# Altium project Linear Charger Power PCB.PrjPcb
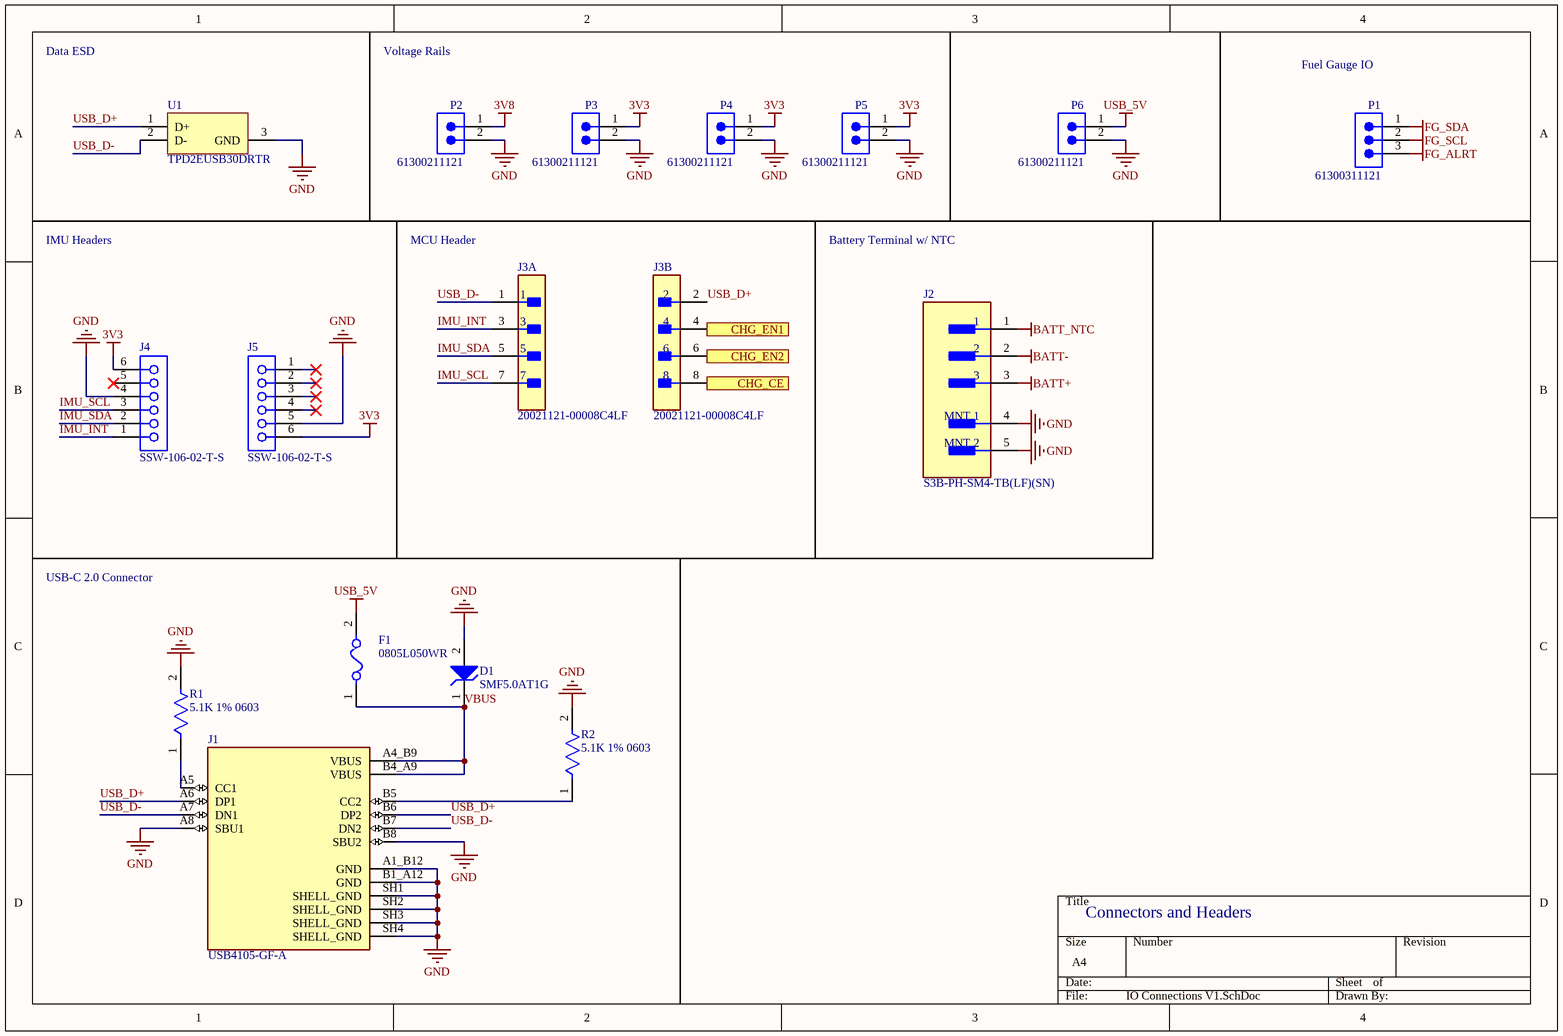
[diagram p0: IO Connections V1.SchDoc]
3 sheets, 47 parts. Net scope: flat (ports and power ports of the same name join across sheets).
Board file: Linear Charge PCB.PcbDoc
Sheets:
  IO Connections V1.SchDoc
  Charge Managment ICs.SchDoc
  Voltage Regs.SchDoc

## Sheet IO Connections V1.SchDoc
size A4; SheetNumber: 1; SheetTotal: 3

### Parts
D1  SMF5.0AT1G  [ONSC-SOD-123FL-2-498_V]
F1  0805L050WR  [FP-0805L-MFG]
J1  USB4105-GF-A  [GCT_USB4105-GF-A]
J2  S3B-PH-SM4-TB(LF)(SN)  [FP-S3B-PH-SM4-TB_LF_SN-MFG]
J3  20021121-00008C4LF  [FP-20021121-00008C4LF-MFG]  (parts A,B of 2)
J4  SSW-106-02-T-S  [SMTC-SSW-106-02-X-S]
J5  SSW-106-02-T-S  [SMTC-SSW-106-02-X-S]
P1  61300311121  [61300311121]
P2  61300211121  [61300211121]
P3  61300211121  [61300211121]
P4  61300211121  [61300211121]
P5  61300211121  [61300211121]
P6  61300211121  [61300211121]
R1  5.1K 1% 0603  [FP-AF0603-MFG]
R2  5.1K 1% 0603  [FP-AF0603-MFG]
U1  TPD2EUSB30DRTR  [DRT0003A]

### Ports
CHG_CE (out), CHG_EN1 (out), CHG_EN2 (out)

### Nets
3V3: J4.6 J5.6 P3.1 P4.1 P5.1
3V8: P2.1
BATT+: J2.3
BATT-: J2.2
BATT_NTC: J2.1
FG_ALRT: P1.3
FG_SCL: P1.2
FG_SDA: P1.1
GND: D1.2(A) J1.A1_B12(GND) J1.A8(SBU1) J1.B1_A12(GND) J1.B8(SBU2) J1.SH1(SHELL_GND) J1.SH2(SHELL_GND) J1.SH3(SHELL_GND) J1.SH4(SHELL_GND) J2.4(MNT_1) J2.5(MNT_2) J4.4 J5.5 P2.2 P3.2 P4.2 P5.2 P6.2 R1.2 R2.2 U1.3(GND)
USB_5V: F1.2 P6.1
IMU_INT: J3.3 J4.1
IMU_SCL: J3.7 J4.3
IMU_SDA: J3.5 J4.2
USB_D+: J1.A6(DP1) J1.B6(DP2) J3.2 U1.1(D+)
USB_D-: J1.A7(DN1) J1.B7(DN2) J3.1 U1.2(D-)
VBUS: D1.1(K) F1.1 J1.A4_B9(VBUS) J1.B4_A9(VBUS)
NetJ1_A5: J1.A5(CC1) R1.1
NetJ1_B5: J1.B5(CC2) R2.1
NetJ3_4: J3.4 ; port CHG_EN1
NetJ3_6: J3.6 ; port CHG_EN2
NetJ3_8: J3.8 ; port CHG_CE

Not connected (* = marked no-connect by the designer): J4 5*; J5 1* 2* 3* 4*

### Notes on the sheet
- Data ESD
- Voltage Rails
- Fuel Gauge IO
- IMU Headers
- MCU Header
- Battery Terminal w/ NTC
- USB-C 2.0 Connector
- Connectors and Headers

### Library data of the parts
D1 = CMP-1061-00612-1: 200 W Transient Voltage Suppressor, 2-Pin SOD-123FL, Pb-Free, Tape and Reel; Manufacturer: On Semiconductor; Direction: Unidirectional; IR Max (uA): 400; V(BR) Typ (V): 6.7; PackageDescription: 2-Pin SOD, Body 1.65 x 2.7 mm; PartNumber: SMF5.0AT1G; ComponentLink3Description: Package Specification; ComponentLink3URL: http://www.onsemi.com/pub_link/Collateral/498-01.PDF; PackageVersion: Rev. D, 05/2013; Mounting Technology: Surface Mount; PackageReference: SOD-123FL-2-498; ComponentLink2URL: http://www.onsemi.com/pub_link/Collateral/SMF5.0AT1-D.PDF; DatasheetVersion: Rev. 7; ComponentLink1Description: Manufacturer URL; Packing: Tape and Reel; RoHS: Pb-Free; ComponentLink1URL: http://www.onsemi.com/; ComponentLink2Description: Datasheet
F1 = CMP-08606-000023-1: PTC RESET FUSE 6V 500MA 0805; Manufacturer: Littelfuse Inc.; Current Rating: 100A; Hold Current: 0.5A; Value: 0.15-0.85Ω; Trip Time: 0.1s; Trip Current: 1A; Device Class L2: PTC Resettable Fuses; Manufacturer Part Number: 0805L050WR; Digikey Description: PTC RESET FUSE 6V 500MA 0805; ComponentLink2URL: https://www.littelfuse.com/~/media/electronics/datasheets/resettable_ptcs/littelfuse_ptc_0805l_datasheet.pdf.pdf; Package: 0805L; RoHS: TRUE; Temperature Range Low: -40°C; Octopart: https://octopart.com/0805l050wr-littelfuse-673858; Resistance: 0.15-0.85Ω; ComponentLink2Description: Datasheet; Category: Fuse; Height: 1.25mm; Mouser Description: PTC Resettable Fuse 0.5A(hold) 1A(trip) 6VDC 100A 0.5W 0.1s 0.15Ohm SMD Solder Pad 0805 T/R; Ambient Temperature Range High: +85°C; Automotive: No; Device Class L3: unset; Lead Free: Yes; Temperature: -40°C to +85°C; Voltage Rating: 6V; Ambient Temperature Range Low: -40°C; Temperature Range High: +85°C; Device Class L1: Circuit Protection
J1 = USB4105-GF-A: MF: {'manufacturer': u'GCT'}; Package: None; Price: None; Value: *; MP: USB4105-GF-A; Availability: Unavailable
J2 = CMP-2000-07023-2: CONN HEADER SMD R/A 3POS 2MM; Voltage Rating: 100V; Gender: Male; Max Current Rating: 2A; Number of Contacts: 3; Insulation Resistance: 1GR; Contact Resistance: 10mR; Termination: Solder; Orientation: Right Angle; Insulation Color: Natural; Flammability Rating: UL94 V-0; Width: 5mm; Lead Free: Lead Free; Mount: Surface Mount; Max Operating Temperature: 85°C; Connector Type: Header; Fastening Type: Detent; Max Voltage Rating (DC): 100V; Housing Material: Polyamide; Number of Rows: 1; Housing Color: Beige; Contact Plating: Tin; Contact Shape: Square; Working Voltage: 100V; Contact Material: Copper Alloy; Contact Mating Length: 0.13inch; Contact Type: Male Pin; Max Voltage Rating (AC): 100V; Packaging: Tape and Reel; Min Operating Temperature: -25°C; Number of Positions: 3; REACH SVHC: No SVHC; Contact Finish - Mating: TIN; Color: Natural; Length: 9.9mm; Insulation Material: Nylon; Depth: 7.6mm; Current Rating: 2A; Material: Polyamide; Voltage Rating (AC): 100V; Pitch: 2mm; Series: PH; Height: 9.4mm; Number of Poles: 3; Lead Pitch: 2mm
J3 = CMP-15126-126517167-1: 20021121-00008C4LF Conn Unshrouded Header HDR 8 POS 1.27mm Solder ST Top Entry SMD Minitek127® T/R; Mating Post Length: 3.05mm; Stack Height: 3mm; Max Voltage Rating (AC): 125V; Number of Contacts: 8; Connector Type: Header, Male Pin; Current Rating: 1A; Gender: Male; Contact Resistance: 30mΩ; Orientation: Straight; Depth: 3.4mm; Min Operating Temperature: -55°C; NexarPartId: 126517167; Contact Mating Length: 3.048mm; Contact Material: Copper; Number of Rows: 2; RoHS: Compliant; Height: 5.05mm; Number of Pins: 8; REACH SVHC: No SVHC; Length: 5.08mm; Housing Color: Black; Pitch: 1.27mm; Termination: Solder; Mount: Surface Mount; Color: Black; Contact Plating: Gold; Row Spacing: 1.27mm; Number of Positions: 8; Housing Material: Thermoplastic; Max Operating Temperature: 85°C; Voltage Rating: 125V
J4 J5 = CMP-1023-00360-1: SQ Post Socket, Through-hole, Vertical, -55 to 105 degC, 2.54mm Pitch, 6-Pin, Female, RoHS; Manufacturer: Samtec; ComponentLink1URL: http://www.samtec.com; Temperature Range: -55 to 105 degC; Pitch: 2.54 mm; Mounting Technology: Through-hole; DatasheetVersion: F-214; ComponentLink1Description: Manufacturer URL; PackageVersion: CA, 6/1987; ComponentLink3Description: Package Specification; PackageDescription: Assembly, Socket Strip .016 X .031 Tail; ComponentLink2Description: Datasheet; ComponentLink2URL: http://www.samtec.com/documents/webfiles/pdf/SSW_TH.PDF; PackageReference: SSW-106-02-X-S; ComponentLink3URL: http://www.samtec.com/documents/webfiles/cpdf/SSW-1XX-XX-XXX-X-XX-XXX-XX-MKT.pdf; RoHS: True; PartNumber: SSW-106-02-T-S; Orientation: Vertical
P1 = CMP-1502-01062-4: THT Vertical Pin Header WR-PHD, Pitch 2.54 mm, Single Row, 3 pins; Connector Type: Male Pin; Number of Contacts: 3; Operating Supply Voltage: 250V; Current Rating: 3A; Pitch: 2.54mm; Contact Resistance: 20mΩ; Gender: Male; Height: 8.94mm; Color: Black; Min Operating Temperature: -40°C; Max Operating Temperature: 105°C; Mount: Through Hole; Termination: Solder; Number of Rows: 1; Packaging: Bulk; Number of Pins: 3; Lead Pitch: 2.54mm; RoHS: Compliant; Contact Plating: Gold; Number of Positions: 3; Lead Free: Lead Free; Voltage Rating: 250V; Contact Mating Length: 5.9944mm; Orientation: Vertical; Contact Material: Gold
P2-P6 = CMP-1712-00002-7: THT Vertical Pin Header WR-PHD, Pitch 2.54 mm, Single Row, 2 pins; Pitch: 2.54mm; Number of Contacts: 2; Connector Type: Male Pin; Gender: Male; Contact Resistance: 20mΩ; Operating Supply Voltage: 250V; Current Rating: 3A; Housing Material: PBT; RoHS: Compliant; Lead Free: Lead Free; Contact Material: Gold; REACH SVHC: No; Min Operating Temperature: -40°C; Termination: Through Hole; Number of Pins: 2; Contact Gender: Male; Packaging: Bulk; Lead Pitch: 2.54mm; Contact Plating: Gold; Orientation: Vertical; Mount: Through Hole; Height: 8.94mm; Color: Black; Number of Positions: 2; Contact Mating Length: 5.9944mm; Max Operating Temperature: 105°C; Voltage Rating: 250V; Number of Rows: 1
R1 R2 = CMP-03412-041991-1: Anti-Sulfurated Chip Resistors Automotive Grade 5.1kΩ 1% 100ppm/°C 0603; Max Power Dissipation: 100mW; Resistance: 5.1kR; Case/Package: 0603; Features: Moisture Resistant; Tolerance: 1%; Packaging: Tape and Reel; Number of Terminations: 2; Max Operating Temperature: 155°C; Height: 0.022inch; Temperature Coefficient: 100ppm/°C; Resistor Type: Thick Film; Width: 0.031inch; Min Operating Temperature: -55°C; Length: 0.063inch; RoHS Compliant: Yes; Series: AF
U1 = CMP-0326-00046-3: ESD Solution for Super-Speed (6 Gbps) USB 3.0 Interface, 2 Channels, -40 to +85 degC, 3-pin SOT (DRT), Green (Rohs & No Sb/Br); Manufacturer: Texas Instruments; Differential Capacitance(pF): 0.01; Breakdown Voltage(Min)(V): 9; HDMI: TRUE; IEC 61000-4-2 Air-Gap(+/- kV): 8; IO Leakage Current(nA): 10; IO Capacitance(Typ)(pF): 0.7; Mounting Technology: Surface Mount; PackageDescription: 3-Flat Lead Plastic Small Outline, 1 x 1 mm (inc leads), 0.35 mm Pitch; IEC 61000-4-2 Contact(+/- kV): 8; USB Super Speed: TRUE; Eco-Plan: Green (RoHS & no Sb/Br); USB High Speed: TRUE; PackageReference: DRT0003A; SubFamily: ESD Solution; USB Full Speed: TRUE; ComponentLink1Description: Datasheet; ComponentLink2URL: SamplesURL:http://www.ti.com/product/tpd2eusb30#samples; PackageVersion: revD, Jun-2008; ComponentLink2Description: URL Link1; 1394 / Firewire: TRUE; PartNumber: TPD2EUSB30DRTR; ComponentLink1URL: http://www.ti.com/general/docs/lit/getliterature.tsp?genericPartNumber=TPD2EUSB30&fileType=pdf; DatasheetVersion: SLVSAC2C; Serial ATA / eSATA: TRUE

## Sheet Charge Managment ICs.SchDoc
size A4; SheetNumber: 2; SheetTotal: 3; SPICEModelCacheYUDMBZLM: <root> / <DocumentId>YUDMBZLM</DocumentId> / </root>
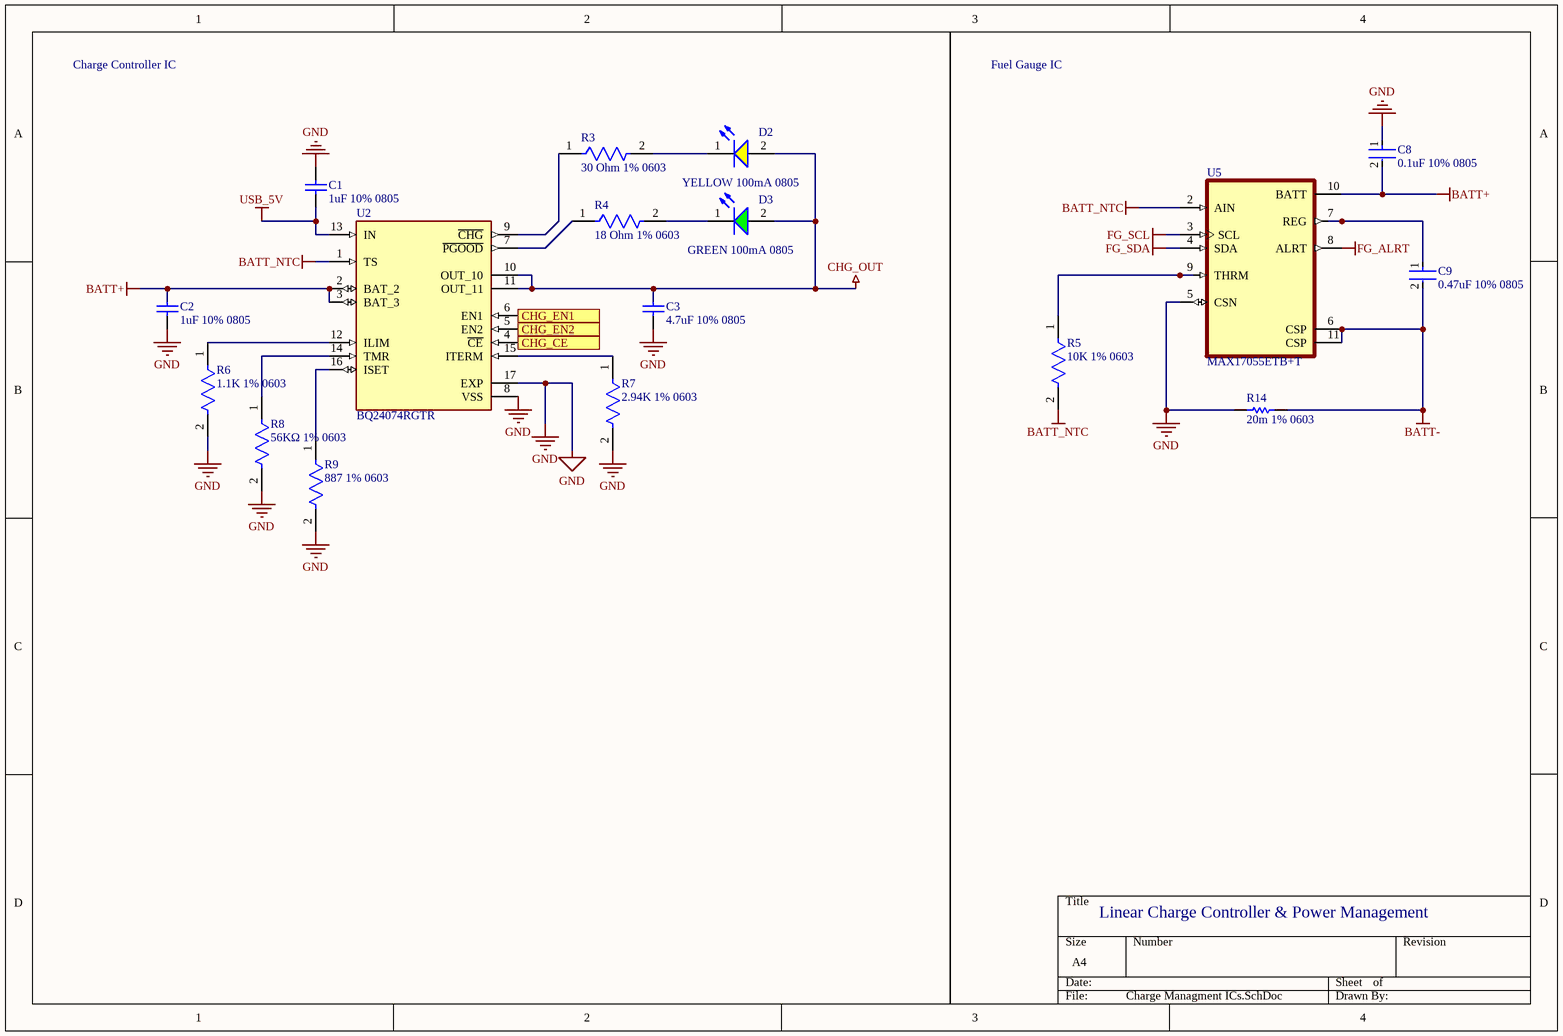
[diagram p1: Charge Managment ICs.SchDoc]

### Parts
C1  1uF 10% 0805  [CAPC2013X100X50LL20T25]
C2  1uF 10% 0805  [CAPC2013X100X50LL20T25]
C3  4.7uF 10% 0805  [CAPC2013X145X50ML20T25]
C8  0.1uF 10% 0805  [FP-AC0805-0_85-MFG]
C9  0.47uF 10% 0805  [FP-C0805C-DN-MFG]
D2  YELLOW 100mA 0805  [WL-SMCW_0805_150080xx75000]
D3  GREEN 100mA 0805  [WL-SMCW_0805_150080xx75000]
R3  30 Ohm 1% 0603  [FP-AC0603-IPC_B]
R4  18 Ohm 1% 0603  [FP-AC0603-MFG]
R5  10K 1% 0603  [FP-AC0603-MFG]
R6  1.1K 1% 0603  [FP-AC0603-IPC_B]
R7  2.94K 1% 0603  [FP-AC0603-IPC_A]
R8  56KΩ 1% 0603  [FP-AC0603-MFG]
R9  887 1% 0603  [FP-RMCF0603-IPC_A]
R14  20m 1% 0603  [RESC1508X46X38ML25T25]
U2  BQ24074RGTR  [QFN50P300X300X100-17N]
U5  MAX17055ETB+T  [SON40P200X250X80-11N]

### Ports
CHG_CE (in), CHG_EN1 (in), CHG_EN2 (in)

### Nets
BATT+: C2.2 C8.2 U2.2(BAT_2) U2.3(BAT_3) U5.10(BATT)
BATT-: C9.2 R14.2 U5.6(CSP) U5.11(CSP)
BATT_NTC: R5.2 U2.1(TS) U5.2(AIN)
CHG_OUT: C3.2 D2.2(A) D3.2(A) U2.10(OUT_10) U2.11(OUT_11)
FG_ALRT: U5.8(ALRT)
FG_SCL: U5.3(SCL)
FG_SDA: U5.4(SDA)
GND: C1.2 C2.1 C3.1 C8.1 R6.2 R7.2 R8.2 R9.2 R14.1 U2.8(VSS) U2.17(EXP) U5.5(CSN)
USB_5V: C1.1 U2.13(IN)
NetC9_1: C9.1 U5.7(REG)
NetD2_1: D2.1(K) R3.2
NetD3_1: D3.1(K) R4.2
NetJ3_4: U2.6(EN1) ; port CHG_EN1
NetJ3_6: U2.5(EN2) ; port CHG_EN2
NetJ3_8: U2.4(~{CE}) ; port CHG_CE
NetR3_1: R3.1 U2.9(~{CHG})
NetR4_1: R4.1 U2.7(~{PGOOD})
NetR5_1: R5.1 U5.9(THRM)
NetR6_1: R6.1 U2.12(ILIM)
NetR7_1: R7.1 U2.15(ITERM)
NetR8_1: R8.1 U2.14(TMR)
NetR9_1: R9.1 U2.16(ISET)

### Notes on the sheet
- Charge Controller IC
- Fuel Gauge IC
- Linear Charge Controller & Power Management

### Library data of the parts
C1 C2 = CMP-1036-04732-2: Manufacturer: Kemet; Part Number: C0805C105K9RACTU
C3 = CMP-2007-01048-1: Part Number: C0805C475K4RACTU; Manufacturer: Kemet
C8 = CMP-03422-000831-1: AC0805 100 nF X7R 10.00% 50 V; Manufacturer: Yageo; Manufacturer Part Number: AC0805KKX7R9BB104; Value: 100 nF; Voltage Rating: 50 V; Tolerance: 0.1; Automotive Grade: Grade 1; Material: Ceramic; Temperature Coefficient: 15%; Octopart: https://octopart.com/ac0805kkx7r9bb104-yageo-90326560; Temperature Range High: +125°C; Footprint Url: http://www.yageo.com/exep/pages/download/literatures/UPY-C_GEN_24.pdf; ComponentLink2Description: Datasheet; Temperature: -55°C to +125°C; Temperature Range Low: -55°C; ComponentLink2URL: http://www.yageo.com/documents/recent/UPY-AC_NP0X7R_16V-to-630V_12.pdf; Height: 0.95mm; RoHS: TRUE; Device Class L1: Passive Components; Capacitance: 100 nF; Lead Free: Yes; Package: AC0805-0.85; Device Class L2: Capacitors; Automotive: Yes; Category: Cap; Temperature Characteristic: X7R; Ipc Land Pattern Name: CAPC200125X85; Device Class L3: Ceramic Capacitors
C9 = CMP-1036-04645-2: CAP CER 0.47UF 25V X7R 0805; Manufacturer: KEMET; Manufacturer Part Number: C0805C474K3RACTU; Material: Ceramic; Value: 0.47 μF; Tolerance: 0.1; Temperature Coefficient: 30ppm/°C; Lead Free: Yes; Device Class L1: Passive Components; ComponentLink2Description: Datasheet; Category: Cap; Temperature: -55°C to +125°C; RoHS: TRUE; Capacitance: 0.47 μF; Automotive: No; Height: 0.88mm; Digikey Description: CAP CER 0.47UF 25V X7R 0805; Device Class L3: Ceramic Capacitors; Package: C0805C-DN; Voltage Rating: 25 V; Octopart: https://octopart.com/c0805c474k3ractu-kemet-90785; Temperature Characteristic: X7R; Temperature Range Low: -55°C; Temperature Range High: +125°C; Device Class L2: Capacitors; Ipc Land Pattern Name: CAPC200125X78; ComponentLink2URL: https://content.kemet.com/datasheets/KEM_C1003_C0G_SMD.pdf
D2 = CMP-1426-00012-4: 2 V Yellow LED 2012 (0805) SMD, Wurth Elektronik WL-SMCW 150080YS75000; Manufacturer Package Identifier: 0805 (2012 metric); Manufacturer Lifecycle Status: ACTIVE; Luminous Intensity: 120mcd; Dominant Wavelength: 590nm; Forward Voltage: 2V; Lens Style: Clear, Rectangular; Reverse Voltage: 5V; YEOL: 1 = Estimated lifetime > 10 years; Viewing Angle: 140°; Power Dissipation: 72mW; Peak Wavelength: 595nm; Max Junction Temperature (Tj): 95°C; Test Current: 20mA; Lifecycle Status: Production; Case Code (Imperial): 0805; Height: 700µm; Min Operating Temperature: -40°C; Case Code (Metric): 2012; RoHS: Compliant; Max Reverse Voltage (DC): 5V; Width: 1.25mm; Case/Package: 0805; Mount: Surface Mount; REACH SVHC: Unknown; Color: Yellow; Packaging: Tape and Reel; Max Operating Temperature: 85°C; Forward Current: 100mA; Length: 2mm; Wavelength: 590nm
D3 = CMP-1426-00007-4: WURTH ELEKTRONIK - 150080GS75000 - LED, Green, SMD, 0805, 30 mA, 3.2 V, 520 nm; Manufacturer Lifecycle Status: ACTIVE; Manufacturer Package Identifier: 0805 (2012 metric); Test Current: 20mA; Wavelength: 525nm; Max Junction Temperature (Tj): 95°C; Luminous Intensity: 450mcd; Reverse Voltage: 5V; Viewing Angle: 140°; Peak Wavelength: 515nm; Lens Style: Clear, Rectangular; Power Dissipation: 105mW; YEOL: 1 = Estimated lifetime > 10 years; Forward Voltage: 3.2V; Mount: Surface Mount; REACH SVHC: Unknown; Height: 700µm; Case Code (Metric): 2012; Case Code (Imperial): 0805; Forward Current: 100mA; Dominant Wavelength: 525nm; RoHS: Compliant; Color: Green; Case/Package: 0805; Length: 2mm; Packaging: Tape and Reel; Max Reverse Voltage (DC): 5V; Min Operating Temperature: -40°C; Max Operating Temperature: 85°C; Width: 1.25mm; Lifecycle Status: Production
R3 = CMP-03412-028950-2: RES 30Ω 1.00% 0.1W 0603; Max Power Dissipation: 100mW; Temperature Coefficient: 100ppm/°C; Resistance: 30R; Features: Moisture Resistant; Packaging: Tape and Reel; Number of Terminations: 2; Tolerance: 1%; Case/Package: 0603; Length: 0.063inch; Resistor Type: Thick Film; Series: AC; RoHS Compliant: Yes; Height: 0.022inch; Width: 0.031inch; Max Operating Temperature: 155°C; Min Operating Temperature: -55°C
R4 = CMP-03412-005942-2: RES 18Ω 1.00% 0.1W 0603; Resistance: 18R; Max Power Dissipation: 100mW; Temperature Coefficient: 100ppm/°C; Height: 0.022inch; Max Operating Temperature: 155°C; Number of Terminations: 2; Length: 0.063inch; Tolerance: 1%; Depth: 0.8mm; Width: 0.031inch; Packaging: Tape and Reel; Min Operating Temperature: -55°C; Series: AC; Resistor Type: Thick Film; Case/Package: 0603; Features: Moisture Resistant; RoHS Compliant: Yes; Military Standard: Not
R5 = CMP-03412-038110-1: RES 10.5KΩ 1.00% 0.1W 0603; RoHS Compliant: Yes
R6 = CMP-03412-029129-2: RES 1.1KΩ 1.00% 0.1W 0603; Max Power Dissipation: 100mW; Resistance: 1.1kR; Voltage Rating: 50V; Temperature Coefficient: 100ppm/°C; Width: 0.8mm; Number of Terminations: 2; Case Code (Imperial): 0603; Max Operating Temperature: 155°C; Power Rating: 100mW; Min Operating Temperature: -55°C; RoHS Compliant: Yes; Series: AC; Length: 0.063inch; Termination: SMD/SMT; Packaging: Tape and Reel; Case/Package: 0603; Features: Moisture Resistant; Height: 0.022inch; Case Code (Metric): 1608; Resistor Type: Thick Film; Tolerance: 1%
R7 = CMP-03412-000673-2: RES 2.94KΩ 1.00% 0.1W 0603; Resistance: 2.94kR; Power Rating: 100mW; Voltage Rating: 50V; Temperature Coefficient: 100ppm/°C; Weight: 7.1E-05oz; Length: 0.063inch; RoHS Compliant: Yes; Features: Moisture Resistant; Max Operating Temperature: 155°C; Series: AC; Case Code (Imperial): 0603; Tolerance: 1%; Width: 0.8mm; Case Code (Metric): 1608; Max Power Dissipation: 100mW; Number of Terminations: 2; Termination: SMD/SMT; Resistor Type: Thick Film; Min Operating Temperature: -55°C; Height: 0.022inch; Packaging: Tape and Reel; Case/Package: 0603
R8 = CMP-03412-027575-2: RES 56KΩ 1.00% 0.1W 0603; RoHS Compliant: Yes
R9 = CMP-26527-006687-1: 887kΩ ±1% 0.1W 0603 Thick Film Chip Resistor AEC-Q200 compliant; Temperature Coefficient: 100ppm/°C; Resistance: 887kR; Mount: Surface Mount; RoHS Compliant: Yes; Tolerance: 1%; Packaging: Tape and Reel; Max Operating Temperature: 155°C; Min Operating Temperature: -55°C; Resistor Type: Thick Film; Case/Package: 0603; Radiation Hardening: No; Contact Plating: Tin
R14 = CMP-2000-03802-1: Manufacturer: Vishay Dale; Part Number: WSL0603R0200FEA
U2 = BQ24074RGTR: Standalone 1-cell 1.5-A linear battery charger, Power Path, 4.2-V VBAT, 10.5-V OVP and 4.4-V VOUT; MF: Texas Instruments; SnapEDA_Link: https://www.snapeda.com/parts/BQ24074RGTR/Texas+Instruments/view-part/?ref=snap; Package: VQFN-16 Texas Instruments; Value: *; MP: BQ24074RGTR; Check_prices: https://www.snapeda.com/parts/BQ24074RGTR/Texas+Instruments/view-part/?ref=eda
U5 = MAX17055ETB+T: Battery Battery Monitor IC Multi-Chemistry 10-TDFN (2.5x2); MF: Maxim Integrated Products; Check_prices: https://www.snapeda.com/parts/MAX17055ETB+T/Maxim+Integrated/view-part/?ref=eda; Package: None; MP: MAX17055ETB+T; Value: *; Availability: In Stock; Purchase-URL: https://pricing.snapeda.com/search/part/MAX17055ETB+T/?ref=eda; SnapEDA_Link: https://www.snapeda.com/parts/MAX17055ETB+T/Maxim+Integrated/view-part/?ref=snap; Price: None

## Sheet Voltage Regs.SchDoc
size A4; SheetNumber: 3; SheetTotal: 3; SPICEModelCacheINGCNGJP: <root> / <DocumentId>INGCNGJP</DocumentId> / </root>
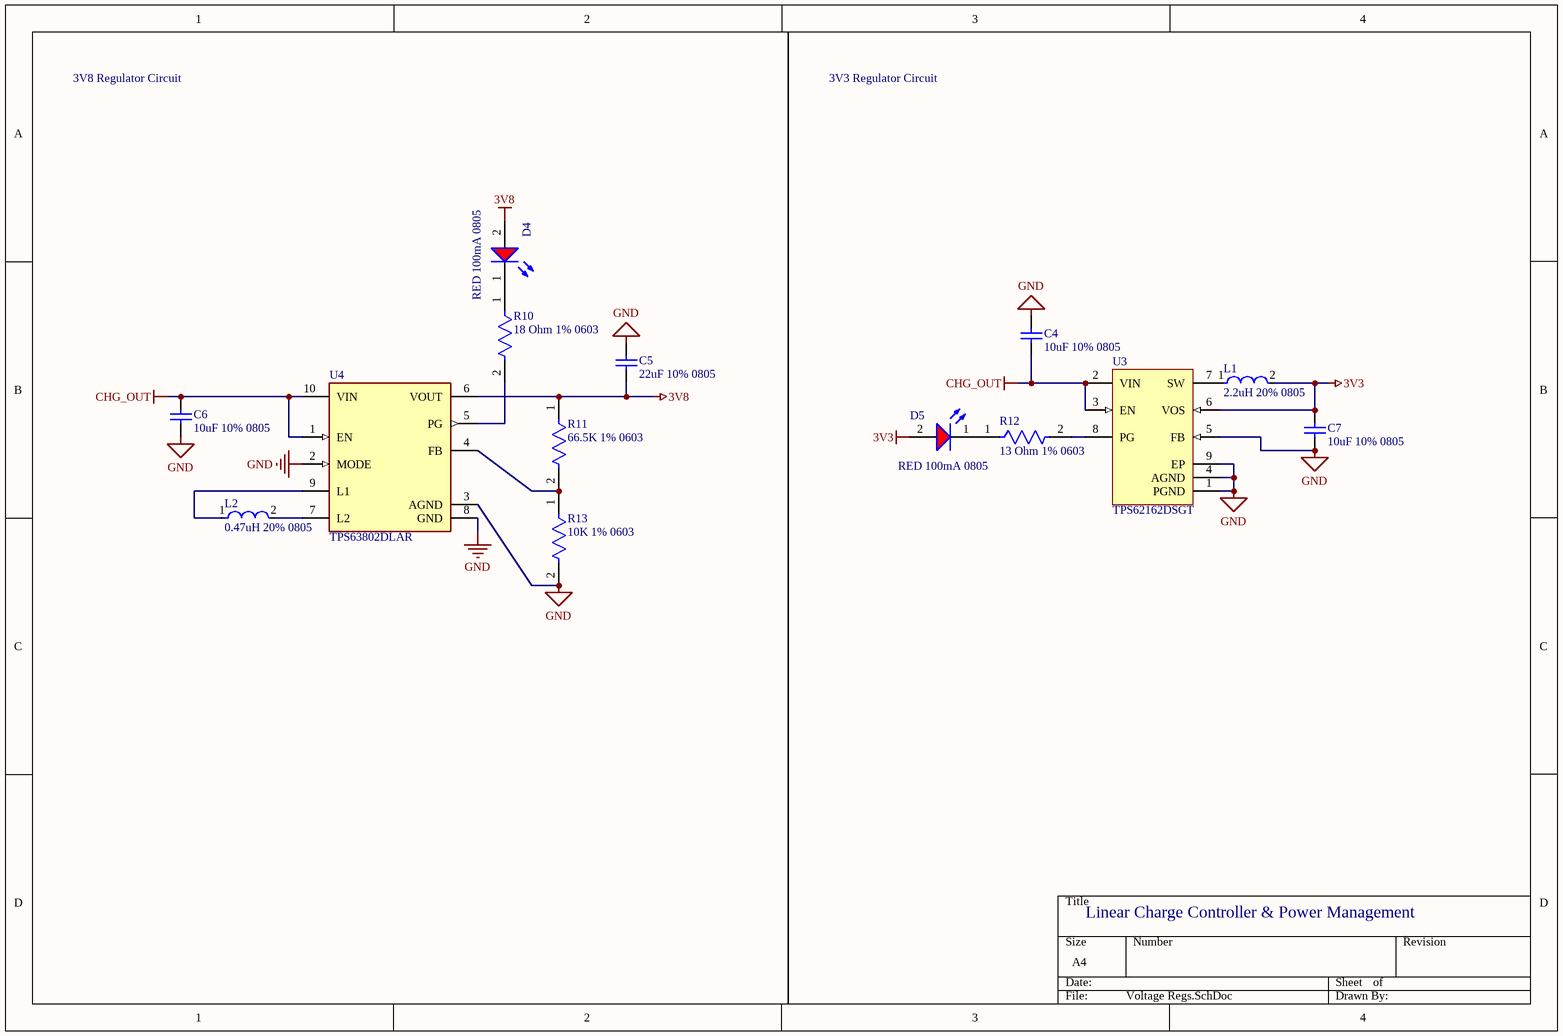
[diagram p2: Voltage Regs.SchDoc]

### Parts
C4  10uF 10% 0805  [CAPC2013X145X50ML20T25]
C5  22uF 10% 0805  [CAPC0805(2012)145_L]
C6  10uF 10% 0805  [CAPC2013X145X50ML20T25]
C7  10uF 10% 0805  [CAPC2013X145X50ML20T25]
D4  RED 100mA 0805  [WL-SMCW_0805_150080xx75000]
D5  RED 100mA 0805  [WL-SMCW_0805_150080xx75000]
L1  2.2uH 20% 0805  [FP-DFE2016CKA-IPC_A]
L2  0.47uH 20% 0805  [FP-LQM21PN_CH-w1_5-IPC_A]
R10  18 Ohm 1% 0603  [FP-AC0603-MFG]
R11  66.5K 1% 0603  [FP-AC0603-MFG]
R12  13 Ohm 1% 0603  [FP-AC0603-MFG]
R13  10K 1% 0603  [FP-AC0603-MFG]
U3  TPS62162DSGT  [DSG0008A_V]
U4  TPS63802DLAR  [FP-DLA0010A-MFG]

### Nets
3V3: C7.2 D5.2(A) L1.2 U3.6(VOS)
3V8: C5.1 D4.2(A) R11.1 U4.6(VOUT)
CHG_OUT: C4.1 C6.2 U3.2(VIN) U3.3(EN) U4.1(EN) U4.10(VIN)
GND: C4.2 C5.2 C6.1 C7.1 R13.2 U3.1(PGND) U3.4(AGND) U3.5(FB) U3.9(EP) U4.2(MODE) U4.3(AGND) U4.8(GND)
NetD4_1: D4.1(K) R10.1
NetD5_1: D5.1(K) R12.1
NetL1_1: L1.1 U3.7(SW)
NetL2_1: L2.1 U4.9(L1)
NetL2_2: L2.2 U4.7(L2)
NetR10_2: R10.2 U4.5(PG)
NetR11_2: R11.2 R13.1 U4.4(FB)
NetR12_2: R12.2 U3.8(PG)

### Notes on the sheet
- 3V8 Regulator Circuit
- 3V3 Regulator Circuit
- Linear Charge Controller & Power Management

### Library data of the parts
C4 C6 C7 = CMP-2007-01044-1: Manufacturer: Kemet; Part Number: C0805C106K8RACTU
C5 = CMP-1036-04938-1: CAP 22uF 6.3V ±10% 0805 (2012 Metric) Thickness 1.45mm SMD; Tolerance: Â±10%; Case-EIA: 0805; Case-Metric: 2012; Technology: SMT; Rated Voltage: 6.3 V; Max Thickness: 1.45 mm; Value: 22uF
D4 D5 = CMP-1426-00011-4: LED Uni-Color Red 630nm 2-Pin Chip 0805(2012Metric) T/R; Manufacturer Lifecycle Status: ACTIVE; Luminous Intensity: 150mcd; Viewing Angle: 140°; Dominant Wavelength: 625nm; Forward Voltage: 2V; Max Reverse Voltage (DC): 5V; Lens Style: Clear, Rectangular; Test Current: 20mA; Max Junction Temperature (Tj): 95°C; Power Dissipation: 72mW; YEOL: 1 = Estimated lifetime > 10 years; Lifecycle Status: Production; Color: Red; Height: 700µm; RoHS: Compliant; Width: 1.25mm; Min Operating Temperature: -40°C; Wavelength: 625nm; Mount: Surface Mount; Max Operating Temperature: 85°C; Forward Current: 100mA; Peak Wavelength: 630nm; Case Code (Imperial): 0805; Manufacturer Package Identifier: 0805 (2012 metric); Length: 2mm; REACH SVHC: Unknown; Case/Package: 0805; Packaging: Tape and Reel; Case Code (Metric): 2012
L1 = CMP-06042-016665-1: Chip Inductors Wirewound Metal Alloy Shielding 0806 Package 2.2uH 20% 1MHz
L2 = CMP-06042-016314-1: Multilayer Type Inductor for Power Lines, 2012, 0.47μH, 20%, 0.138Ω, 1.8A; RoHS Compliant: Yes
R10 = CMP-03412-005942-2: as R4 on sheet Charge Managment ICs; Height: 0.022inch; Max Operating Temperature: 155°C; Number of Terminations: 2; Length: 0.063inch; Tolerance: 1%; Depth: 0.8mm; Width: 0.031inch; Packaging: Tape and Reel; Min Operating Temperature: -55°C; Series: AC; Resistor Type: Thick Film; Case/Package: 0603; Features: Moisture Resistant; RoHS Compliant: Yes; Military Standard: Not
R11 = CMP-03412-000604-2: RES 66.5KΩ 1.00% 0.1W 0603; Resistance: 66.5kR; Temperature Coefficient: 100ppm/°C; Voltage Rating: 50V; Max Power Dissipation: 100mW; Case Code (Imperial): 0603; Height: 0.45mm; Resistor Type: Thick Film; Tolerance: 1%; Min Operating Temperature: -55°C; Max Operating Temperature: 155°C; Features: Moisture Resistant; Length: 1.6mm; Width: 0.8mm; Weight: 7.1E-05oz; Number of Terminations: 2; Case Code (Metric): 1608; Packaging: Tape and Reel; Series: AC; Case/Package: 0603; Termination: SMD/SMT; Ratings: AEC-Q200; RoHS Compliant: Yes; Power Rating: 100mW
R12 = CMP-03412-014777-2: RES 13Ω 1.00% 0.1W 0603; Resistance: 13R; Temperature Coefficient: 100ppm/°C; Max Power Dissipation: 100mW; Width: 0.031inch; Tolerance: 1%; Number of Terminations: 2; Max Operating Temperature: 155°C; RoHS Compliant: Yes; Case/Package: 0603; Series: AC; Length: 0.063inch; Packaging: Tape and Reel; Features: Moisture Resistant; Resistor Type: Thick Film; Min Operating Temperature: -55°C; Height: 0.022inch
R13 = CMP-03412-038553-1: RES 10kΩ 1.00% 0.2W 0603
U3 = CMP-0323-00319-3: Buck Step Down Regulator with 3 to 17 V Input and 3.3 V Output, -40 to 85 degC, 8-Pin WSON (DSG), Green (RoHS & no Sb/Br); Manufacturer: Texas Instruments; Synchronous Rectification: TRUE; Iq(Typ)(mA): 0.017; Switch Current Limit(Typ)(A): 1.8; Regulated Outputs(#): 1; Duty Cycle(Max)(%): 100; SubFamily: Step-Down Regulator; Preset Vout(V): 3.3; Rating: Catalog; Vin(Max)(V): 17; Vin(Min)(V): 3; ComponentLink2Description: Package Specification; PackageVersion: revB, Oct-2010; DatasheetVersion: SLVSAM2A; ComponentLink1Description: Datasheet; PackageDescription: 8-Pin Plastic Small Outline No-Lead, 2 x 2 x 0.8 mm Body, 0.5 mm Pitch, Exposed Pad; ComponentLink2URL: http://www.ti.com/litv/pdf/mpds308a; Code_JEDEC: MO-229; PartNumber: TPS62162DSGT; ComponentLink3URL: Samples URL:http://www.ti.com/product/tps54611#samples; Mounting Technology: Surface Mount; Eco-Plan: Green (RoHS & no Sb/Br); Vout(Min)(V): 3.3; PackageReference: DSG0008A; Topology: Buck; ComponentLink1URL: http://www.ti.com/general/docs/lit/getliterature.tsp?genericPartNumber=TPS62162&fileType=pdf; Vout(Max)(V): 3.3; Iout(Max)(A): 1; ComponentLink3Description: URL Link1
U4 = CMP-04918-000005-1: IC POWER MANAGEMENT; Manufacturer: Texas Instruments; Nominal Supply Current: 11uA; Max Junction Temp: +125°C; Max Supply Voltage: 5.5V; Switching Topology: Buck-Boost; Min Supply Voltage: 1.3V; Output Current: 2A; Output Voltage: 1.8-5.2V; Number Of Outputs: 1; Switching Frequency: 1.4/1.6/2.1MHz; Standoff Height: 0mm; Max Duty Cycle: 100%; Output Type: AdjustableProgrammable; Manufacturer Part Number: TPS63802DLAR; ComponentLink2URL: https://www.ti.com/lit/ds/symlink/tps63802.pdf; Digikey Description: IC POWER MANAGEMENT; Octopart: https://octopart.com/tps63802dlar-texas+instruments-97359678; Height: 1mm; Temperature: -40°C to +125°C; Device Class L3: Voltage Regulators - Switching; Lead Free: Yes; Category: IC; Mouser Description: 2-A, high-efficient, 11-µA quiescent current buck-boost converter in QFN/DFN package 10-VSON-HR -40 to 125; ComponentLink2Description: Datasheet; Temperature Range Low: -40°C; Temperature Range High: +125°C; Automotive: No; Device Class L2: Power Management ICs; RoHS: TRUE; Device Class L1: Integrated Circuits (ICs); Package: DLA0010A

## Nets that join several sheets
3V3: IO Connections V1 (5 pins), Voltage Regs (C7.2 D5.2 L1.2 U3.6)
3V8: IO Connections V1 (P2.1), Voltage Regs (C5.1 D4.2 R11.1 U4.6)
BATT+: IO Connections V1 (J2.3), Charge Managment ICs (5 pins)
BATT-: IO Connections V1 (J2.2), Charge Managment ICs (C9.2 R14.2 U5.6 U5.11)
BATT_NTC: IO Connections V1 (J2.1), Charge Managment ICs (R5.2 U2.1 U5.2)
CHG_OUT: Charge Managment ICs (5 pins), Voltage Regs (6 pins)
FG_ALRT: IO Connections V1 (P1.3), Charge Managment ICs (U5.8)
FG_SCL: IO Connections V1 (P1.2), Charge Managment ICs (U5.3)
FG_SDA: IO Connections V1 (P1.1), Charge Managment ICs (U5.4)
GND: IO Connections V1 (21 pins), Charge Managment ICs (12 pins), Voltage Regs (12 pins)
USB_5V: IO Connections V1 (F1.2 P6.1), Charge Managment ICs (C1.1 U2.13)
NetJ3_4: IO Connections V1 (J3.4), Charge Managment ICs (U2.6)
NetJ3_6: IO Connections V1 (J3.6), Charge Managment ICs (U2.5)
NetJ3_8: IO Connections V1 (J3.8), Charge Managment ICs (U2.4)